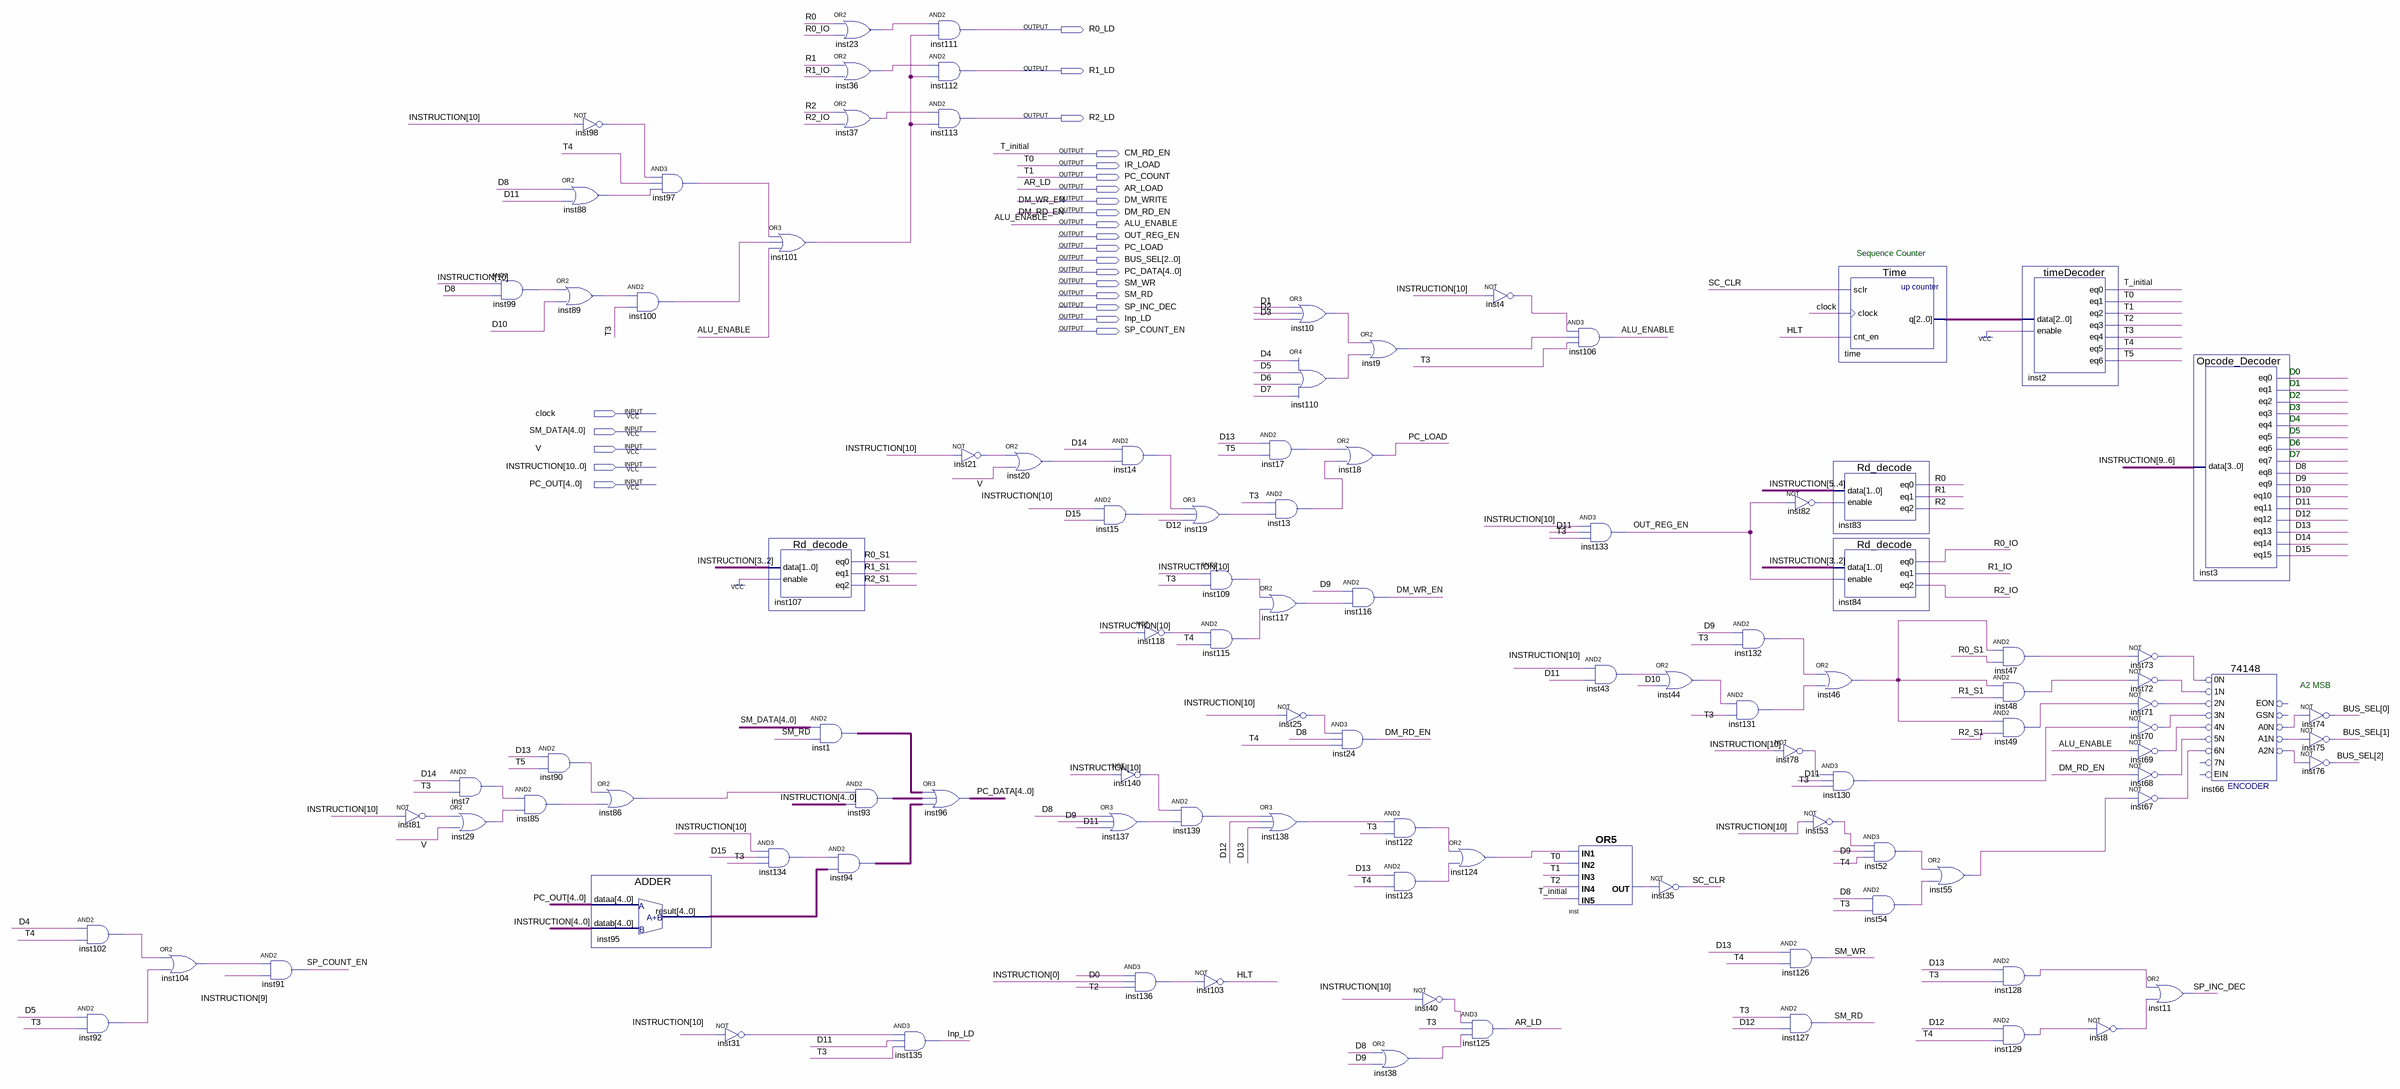
[diagram p0: schematic sheet]
// Quartus schematic Control_Unit.bdf as structural Verilog: 104 symbols, 24 pins
module Control_Unit (
  input  clock,
  input  [4:0] SM_DATA,
  input  V,
  input  [10:0] INSTRUCTION,
  input  [4:0] PC_OUT,
  output R0_LD,
  output R1_LD,
  output R2_LD,
  output CM_RD_EN,
  output IR_LOAD,
  output PC_COUNT,
  output AR_LOAD,
  output DM_WRITE,
  output DM_RD_EN,
  output ALU_ENABLE,
  output OUT_REG_EN,
  output PC_LOAD,
  output [2:0] BUS_SEL,
  output [4:0] PC_DATA,
  output SM_WR,
  output SM_RD,
  output SP_INC_DEC,
  output Inp_LD,
  output SP_COUNT_EN
);

  wire D0, D1, D2, D3, D4, D5, D6, D7, D8, D9, D10, D11, D12, D13, D14, D15, HLT, inst4_out, inst7_out,
       inst8_out, inst9_out, inst10_out, inst13_out, inst14_out, inst15_out, inst17_out, inst19_out,
       inst20_out, inst21_out, inst23_out, inst25_out, inst29_out, inst31_out, inst36_out, inst37_out,
       inst38_out, inst40_out, inst43_out, inst44_out, inst46_out, inst47_out, inst48_out, inst49_out,
       inst52_out, inst53_out, inst54_out, inst55_out, inst66_a0n, inst66_a1n, inst66_a2n, inst67_out,
       inst68_out, inst69_out, inst70_out, inst71_out, inst72_out, inst73_out, inst78_out, inst81_out,
       inst82_out, inst85_out, inst86_out, inst88_out, inst89_out, inst90_out, inst92_out, inst97_out,
       inst98_out, inst99_out, inst100_out, inst101_out, inst102_out, inst104_out, inst109_out, inst110_out,
       inst115_out, inst117_out, inst118_out, inst122_out, inst123_out, inst124_out, inst128_out,
       inst129_out, inst130_out, inst131_out, inst132_out, inst134_out, inst136_out, inst137_out,
       inst138_out, inst139_out, inst140_out, inst_out, R0, R0_IO, R0_S1, R1, R1_IO, R1_S1, R2, R2_IO, R2_S1,
       SC_CLR, T2, T3, T4, T5;
  wire [2:0] time_q;
  wire [4:0] inst1_out, inst93_out, inst94_out, inst95_result;

  and inst102 (inst102_out, D4, T4);
  and inst92 (inst92_out, D5, T3);
  or inst104 (inst104_out, inst102_out, inst92_out);
  and inst91 (SP_COUNT_EN, inst104_out, INSTRUCTION[9]);
  not inst81 (inst81_out, INSTRUCTION[10]);
  and inst7 (inst7_out, D14, T3);
  or inst29 (inst29_out, inst81_out, V);
  and inst99 (inst99_out, INSTRUCTION[10], D8);
  and inst90 (inst90_out, D13, T5);
  and inst85 (inst85_out, inst7_out, inst29_out);
  not inst98 (inst98_out, INSTRUCTION[10]);
  or inst88 (inst88_out, D8, D11);
  or inst89 (inst89_out, inst99_out, D10);
  or inst86 (inst86_out, inst90_out, inst85_out);
  ADDER inst95 (.dataa(PC_OUT), .datab(INSTRUCTION[4:0]), .result(inst95_result));
  and inst100 (inst100_out, inst89_out, T3);
  and inst97 (inst97_out, inst98_out, T4, inst88_out);
  not inst31 (inst31_out, INSTRUCTION[10]);
  or inst101 (inst101_out, inst97_out, inst100_out, ALU_ENABLE);
  Rd_decode inst107 (.data(INSTRUCTION[3:2]), .enable(1'b1), .eq0(R0_S1), .eq1(R1_S1), .eq2(R2_S1));
  and inst134 (inst134_out, INSTRUCTION[10], D15, T3);
  or inst23 (inst23_out, R0, R0_IO);
  or inst36 (inst36_out, R1, R1_IO);
  or inst37 (inst37_out, R2, R2_IO);
  assign inst1_out = SM_DATA & {5{SM_RD}};  // AND2 inst1, 5 bits wide
  assign inst94_out = {5{inst134_out}} & inst95_result;  // AND2 inst94, 5 bits wide
  assign inst93_out = {5{inst86_out}} & INSTRUCTION[4:0];  // AND2 inst93, 5 bits wide
  and inst111 (R0_LD, inst23_out, inst101_out);
  and inst112 (R1_LD, inst36_out, inst101_out);
  and inst113 (R2_LD, inst37_out, inst101_out);
  assign PC_DATA = inst1_out | inst93_out | inst94_out;  // OR3 inst96, 5 bits wide
  and inst135 (Inp_LD, inst31_out, D11, T3);
  not inst21 (inst21_out, INSTRUCTION[10]);
  or inst20 (inst20_out, inst21_out, V);
  and inst14 (inst14_out, D14, inst20_out);
  and inst15 (inst15_out, INSTRUCTION[10], D15);
  not inst140 (inst140_out, INSTRUCTION[10]);
  or inst137 (inst137_out, D8, D9, D11);
  not inst118 (inst118_out, INSTRUCTION[10]);
  and inst136 (inst136_out, D0, INSTRUCTION[0], T2);
  or inst19 (inst19_out, inst14_out, inst15_out, D12);
  and inst109 (inst109_out, INSTRUCTION[10], T3);
  and inst115 (inst115_out, inst118_out, T4);
  and inst139 (inst139_out, inst140_out, inst137_out);
  not inst103 (HLT, inst136_out);
  and inst17 (inst17_out, D13, T5);
  or inst117 (inst117_out, inst109_out, inst115_out);
  or inst138 (inst138_out, inst139_out, D12, D13);
  or inst10 (inst10_out, D1, D2, D3);
  or inst110 (inst110_out, D4, D5, D6, D7);
  and inst13 (inst13_out, T3, inst19_out);
  not inst25 (inst25_out, INSTRUCTION[10]);
  or inst18 (PC_LOAD, inst17_out, inst13_out);
  and inst116 (DM_WRITE, D9, inst117_out);
  and inst24 (DM_RD_EN, inst25_out, D8, T4);
  or inst9 (inst9_out, inst10_out, inst110_out);
  and inst122 (inst122_out, inst138_out, T3);
  and inst123 (inst123_out, D13, T4);
  or inst38 (inst38_out, D8, D9);
  or inst124 (inst124_out, inst122_out, inst123_out);
  not inst40 (inst40_out, INSTRUCTION[10]);
  not inst4 (inst4_out, INSTRUCTION[10]);
  and inst125 (AR_LOAD, inst40_out, T3, inst38_out);
  and inst106 (ALU_ENABLE, inst4_out, inst9_out, T3);
  and inst133 (OUT_REG_EN, INSTRUCTION[10], D11, T3);
  and inst43 (inst43_out, INSTRUCTION[10], D11);
  or inst (inst_out, inst124_out, IR_LOAD, PC_COUNT, T2, CM_RD_EN);
  or inst44 (inst44_out, inst43_out, D10);
  not inst35 (SC_CLR, inst_out);
  and inst132 (inst132_out, D9, T3);
  and inst131 (inst131_out, inst44_out, T3);
  not inst78 (inst78_out, INSTRUCTION[10]);
  and inst126 (SM_WR, D13, T4);
  and inst127 (SM_RD, T3, D12);
  not inst82 (inst82_out, OUT_REG_EN);
  or inst46 (inst46_out, inst132_out, inst131_out);
  and inst130 (inst130_out, inst78_out, D11, T3);
  not inst53 (inst53_out, INSTRUCTION[10]);
  Time \time  (.sclr(SC_CLR), .clock(clock), .cnt_en(HLT), .q(time_q));
  Rd_decode inst83 (.data(INSTRUCTION[5:4]), .enable(inst82_out), .eq0(R0), .eq1(R1), .eq2(R2));
  Rd_decode inst84 (.data(INSTRUCTION[3:2]), .enable(OUT_REG_EN), .eq0(R0_IO), .eq1(R1_IO), .eq2(R2_IO));
  and inst52 (inst52_out, inst53_out, D9, T4);
  and inst54 (inst54_out, D8, T3);
  or inst55 (inst55_out, inst52_out, inst54_out);
  and inst47 (inst47_out, inst46_out, R0_S1);
  and inst48 (inst48_out, inst46_out, R1_S1);
  and inst49 (inst49_out, inst46_out, R2_S1);
  and inst128 (inst128_out, D13, T3);
  and inst129 (inst129_out, D12, T4);
  timeDecoder inst2 (
    .data(time_q), .enable(1'b1), .eq0(CM_RD_EN), .eq1(IR_LOAD), .eq2(PC_COUNT), .eq3(T2), .eq4(T3),
    .eq5(T4), .eq6(T5));
  not inst8 (inst8_out, inst129_out);
  not inst73 (inst73_out, inst47_out);
  not inst72 (inst72_out, inst48_out);
  not inst71 (inst71_out, inst49_out);
  not inst70 (inst70_out, inst130_out);
  not inst69 (inst69_out, ALU_ENABLE);
  not inst68 (inst68_out, DM_RD_EN);
  not inst67 (inst67_out, inst55_out);
  or inst11 (SP_INC_DEC, inst128_out, inst8_out);
  Opcode_Decoder inst3 (
    .data(INSTRUCTION[9:6]), .eq0(D0), .eq1(D1), .eq2(D2), .eq3(D3), .eq4(D4), .eq5(D5), .eq6(D6), .eq7(D7),
    .eq8(D8), .eq9(D9), .eq10(D10), .eq11(D11), .eq12(D12), .eq13(D13), .eq14(D14), .eq15(D15));
  \74148  inst66 (
    .\5N (inst68_out), .\0N (inst73_out), .\1N (inst72_out), .\2N (inst71_out), .\3N (inst70_out),
    .\4N (inst69_out), .\6N (inst67_out), .A1N(inst66_a1n), .A0N(inst66_a0n), .A2N(inst66_a2n));  // open: EIN, 7N, EON, GSN
  not inst74 (BUS_SEL[0], inst66_a0n);
  not inst75 (BUS_SEL[1], inst66_a1n);
  not inst76 (BUS_SEL[2], inst66_a2n);

  // Other names for the same wires on the sheet: AR_LD = AR_LOAD; DM_WR_EN = DM_WRITE; T0 = IR_LOAD; T1 = PC_COUNT;
  //   T_initial = CM_RD_EN

  // Notes on the sheet:
  //   Sequence Counter
  //   D0
  //   D1
  //   D2
  //   D3
  //   D4
  //   D5
  //   D6
  //   D7
  //   A2 MSB
endmodule
